# Altium schematic sheet Opamp-Sheet2.SchDoc
size A4; DocumentNumber: 2; SheetNumber: 2; SheetTotal: 3
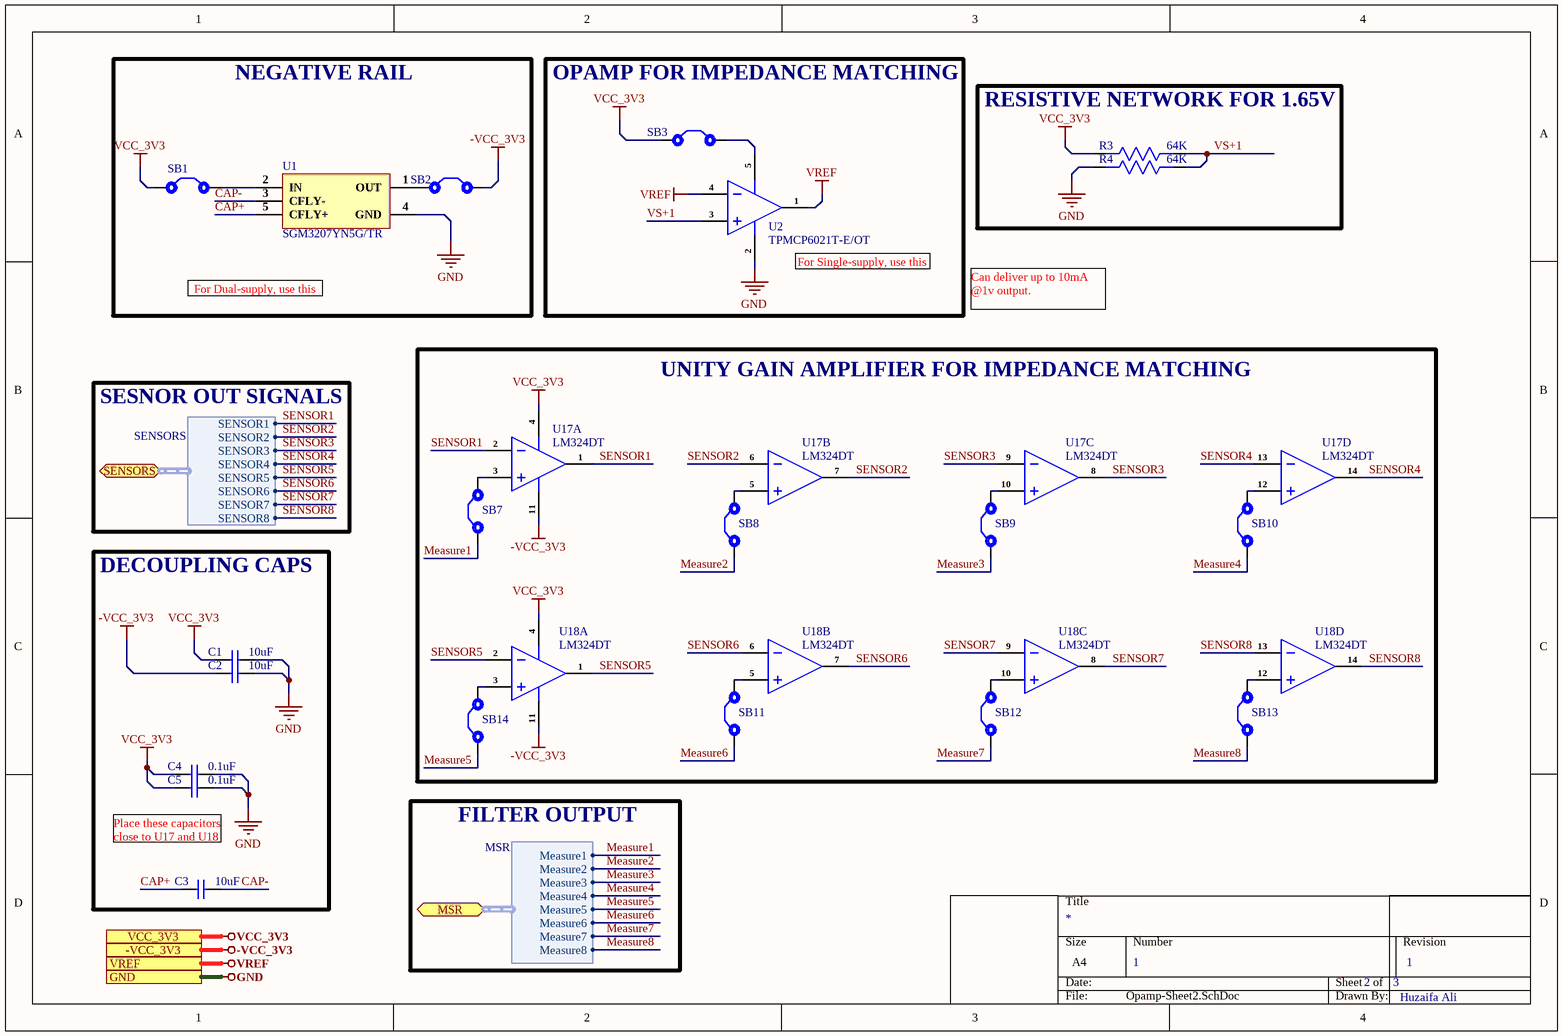
[diagram p0: Opamp-Sheet2.SchDoc]

## Parts
C1  10uF  [Cap-0603]
C2  10uF  [Cap-0603]
C3  10uF  [Cap-0603]
C4  0.1uF  [Cap-0402]
C5  0.1uF  [Cap-0402]
R3  64K  [Res-0603]
R4  64K  [Res-0603]
SB1  Solder Bridge  [Solder Bridge]  (value not drawn)
SB2  Solder Bridge  [Solder Bridge]  (value not drawn)
SB3  Solder Bridge  [Solder Bridge]  (value not drawn)
SB7  Solder Bridge 0603  [Solder Bridge]  (value not drawn)  (no BOM)
SB8  Solder Bridge 0603  [Solder Bridge]  (value not drawn)  (no BOM)
SB9  Solder Bridge 0603  [Solder Bridge]  (value not drawn)  (no BOM)
SB10  Solder Bridge 0603  [Solder Bridge]  (value not drawn)  (no BOM)
SB11  Solder Bridge 0603  [Solder Bridge]  (value not drawn)  (no BOM)
SB12  Solder Bridge 0603  [Solder Bridge]  (value not drawn)  (no BOM)
SB13  Solder Bridge 0603  [Solder Bridge]  (value not drawn)  (no BOM)
SB14  Solder Bridge 0603  [Solder Bridge]  (value not drawn)  (no BOM)
U1  SGM3207YN5G/TR  [SOT-23-5]
U2  TPMCP6021T-E/OT  [SOT-23-5]
U17  LM324DT  [SO-14]  (parts A,B,C,D of 4)
U18  LM324DT  [SO-14]  (parts A,B,C,D of 4)

## Blocks framed on the sheet
NEGATIVE RAIL: SB1 SB2 U1
OPAMP FOR IMPEDANCE MATCHING: SB3 U2
RESISTIVE NETWORK FOR 1.65V: R3 R4
UNITY GAIN AMPLIFIER FOR IMPEDANCE MATCHING: SB7-SB14 U17 U18
DECOUPLING CAPS: C1-C5

## Ports
-VCC_3V3, GND, MSR (bidir, harness MSR), SENSORS (bidir, harness SENSORS), VCC_3V3, VREF

## Harnesses
SENSORS: SENSOR1, SENSOR2, SENSOR3, SENSOR4, SENSOR5, SENSOR6, SENSOR7, SENSOR8
MSR: Measure1, Measure2, Measure3, Measure4, Measure5, Measure6, Measure7, Measure8

## Nets
-VCC_3V3: C2.1 SB2.2 U17.11(VCC-) U18.11(VCC-) ; port -VCC_3V3
GND: C1.2 C2.2 C4.2 C5.2 R4.2 U1.4(GND) U2.2(V-) ; port GND
VCC_3V3: C1.1 C4.1 C5.1 R3.2 SB1.1 SB3.1 U17.4(VCC+) U18.4(VCC+) ; port VCC_3V3
VREF: U2.1(OUT) U2.4(IN-) ; port VREF
CAP+: C3.1 U1.5(CFLY+)
CAP-: C3.2 U1.3(CFLY-)
Measure1: SB7.1 ; port MSR.Measure1
Measure2: SB8.1 ; port MSR.Measure2
Measure3: SB9.1 ; port MSR.Measure3
Measure4: SB10.1 ; port MSR.Measure4
Measure5: SB14.1 ; port MSR.Measure5
Measure6: SB11.1 ; port MSR.Measure6
Measure7: SB12.1 ; port MSR.Measure7
Measure8: SB13.1 ; port MSR.Measure8
SENSOR1: U17.1(1OUT) U17.2(IN-) ; port SENSORS.SENSOR1
SENSOR2: U17.6(2IN-) U17.7(2OUT) ; port SENSORS.SENSOR2
SENSOR3: U17.8(3OUT) U17.9(3IN-) ; port SENSORS.SENSOR3
SENSOR4: U17.13(4IN-) U17.14(4OUT) ; port SENSORS.SENSOR4
SENSOR5: U18.1(1OUT) U18.2(IN-) ; port SENSORS.SENSOR5
SENSOR6: U18.6(2IN-) U18.7(2OUT) ; port SENSORS.SENSOR6
SENSOR7: U18.8(3OUT) U18.9(3IN-) ; port SENSORS.SENSOR7
SENSOR8: U18.13(4IN-) U18.14(4OUT) ; port SENSORS.SENSOR8
VS+1: R3.1 R4.1 U2.3(IN+)
NetSB1_2: SB1.2 U1.2(IN)
NetSB2_1: SB2.1 U1.1(OUT)
NetSB3_2: SB3.2 U2.5(V+)
NetSB7_2: SB7.2 U17.3(IN+)
NetSB8_2: SB8.2 U17.5(2IN+)
NetSB9_2: SB9.2 U17.10(3IN+)
NetSB10_2: SB10.2 U17.12(4IN+)
NetSB11_2: SB11.2 U18.5(2IN+)
NetSB12_2: SB12.2 U18.10(3IN+)
NetSB13_2: SB13.2 U18.12(4IN+)
NetSB14_2: SB14.2 U18.3(IN+)

## Notes on the sheet
- For Dual-supply, use this
- (near U2) For Single-supply, use this
- Can deliver up to 10mA @1v output.
- SESNOR OUT SIGNALS
- Place these capacitors close to U17 and U18
- FILTER OUTPUT
- 1
- Huzaifa Ali

## Library data of the parts
C1-C3 = CL10A106MA8NRNC: CAP CER 10UF 25V X5R 0603; Manufacturer: Samsung; Tolerance: 20%; Supplier 1: Avnet; Manufacturer Part Number: CL10A106MA8NRNC; RoHS: Yes; Category: Ceramic Capacitors; Pricing 1: 4000=0.03753, 8000=0.03700, 16000=0.03595, 24000=0.03515, 32000=0.03383, 40000=0.03304, 400000=0.03225 (USD); Mount: Surface Mount; Case/Package: 0603; Case Code (Metric): 1608; Case Code (Imperial): 0603; Contact Plating: Tin; Min Operating Temperature: -55°C; Max Operating Temperature: 85°C; Package Quantity: 1; Packaging: Tape and Reel; Capacitance: 10uF; Voltage Rating: 25V; Dielectric: X5R; Termination: Wraparound; Series: CL; Construction: Flat; Length: 0.063inch; Width: 0.031inch; Thickness: 0.035inch; Lead Free: Lead Free; RoHS Compliant: Yes; ComponentLink1URL: https://datasheet.ciiva.com/25766/cl10a106ma8nrnc-25766562.pdf?src-supplier=Digi-Key; ComponentLink1Description: https://datasheet.ciiva.com/25766/cl10a106ma8nrnc-25766562.pdf?src-supplier=Digi-Key; Supplier Part Number 1: CL10A106MA8NRNC; LCSC Part Number: C96446
C4 C5 = GRM155R71H104ME14D: CAP CER 0.1UF 50V X7R 0402; Manufacturer: Murata; Tolerance: 20%; Capacitance: 100nF; Item Type: Capacitor; Supplier 1: Avnet; Manufacturer Part Number: GRM155R71H104ME14D; Stock 1: 100000; Pricing 1: 10000=0.00444, 20000=0.00420, 40000=0.00396, 60000=0.00372, 80000=0.00348, 100000=0.00324, 1000000=0.00300 (USD); Mount: Surface Mount; Case/Package: 0402; Min Operating Temperature: -55°C; Max Operating Temperature: 125°C; Packaging: Cut Tape; Voltage Rating: 50V; Length: 0.039inch; Width: 0.02inch; Thickness: 0.022inch; ComponentLink1URL: http://www.mouser.com/ds/2/281/c02e-2905.pdf?src-supplier=Mouser; ComponentLink1Description: http://www.mouser.com/ds/2/281/c02e-2905.pdf?src-supplier=Mouser; ComponentLink2URL: http://search.murata.co.jp/Ceramy/image/img/A01X/G101/ENG/GRM155R71H104ME14-01.pdf?src-supplier=Digi-Key; ComponentLink2Description: http://search.murata.co.jp/Ceramy/image/img/A01X/G101/ENG/GRM155R71H104ME14-01.pdf?src-supplier=Digi-Key; ComponentLink3URL: http://psearch.en.murata.com/capacitor/product/GRM155R71H104ME14%23.pdf?src-supplier=Avnet; ComponentLink3Description: http://psearch.en.murata.com/capacitor/product/GRM155R71H104ME14%23.pdf?src-supplier=Avnet; Supplier Part Number 1: GRM155R71H104ME14D; RoHS: Yes; Category: Ceramic Capacitors; RoHS Compliant: Yes; LCSC Part Number: C182412
R3 R4 = ARG03DTC6402N: 1/10W Thin Film Resistor 75V ±0.5% ±25ppm/℃ -55℃~+155℃ 64kΩ 0603 Chip Resistor - Surface Mount ROHS; Manufacturer: iking Tech; Value: 64K; Manufacturer Part Number: ARG03DTC6402N; Footprint: 0603; ComponentLink1Description: LCSC; ComponentLink1URL: https://lcsc.com/product-detail/Chip-Resistor-Surface-Mount_Viking-Tech-ARG03DTC6402N_C2902643.html; LCSC Part Number: C2902643; Item Type: Resistor
SB1-SB3 = Solder Bridge: Solder Bridge ON
SB7-SB14 = Solder Bridge 0603: Solder Bridge ON; Manufacturer Part Number: Solder Bridge; Item Type: Solder Bridge
U1 = SGM3207YN5G/TR: NO Charge pump 1 -5.5V~-1.4V 1.4V~5.5V 60mA 19kHz SOT-23-5 DC-DC Converters ROHS; Manufacturer: SG Micro; Item Type: IC; Supplier 1: Avnet; Manufacturer Part Number: SGM3207YN5G/TR; RoHS: No; Category: Uncategorized; Pricing 1: 3000=0.38750, 6000=0.36250, 12000=0.33750, 18000=0.32500, 24000=0.31250, 30000=0.31250, 300000=0.30500 (USD); LCSC Part Number: C80403; Supplier Part Number 1: SGM3207YN5G/TR
U2 = TPMCP6021T-E/OT: SOT-23-5 Operational Amplifier ROHS; Manufacturer: TECH PUBLIC; Item Type: IC; Manufacturer Part Number: TPMCP6021T-E/OT; LCSC Part Number: C2923365; ComponentLink1Description: LCSC; ComponentLink1URL: https://www.lcsc.com/product-detail/Operational-Amplifier_TECH-PUBLIC-TPMCP6021T-E-OT_C2923365.html
U17 U18 = LM324DT: IC OPAMP GP 1.3MHZ 14SO; Manufacturer: STMicroelectronics; Max Supply Voltage: 30V; Min Supply Voltage: 3V; Min Dual Supply Voltage: 1.5V; Max Dual Supply Voltage: 15V; Voltage Gain: 100dB; Slew Rate: 0.4V/µs; Common Mode Rejection Ratio: 70dB; Nominal Supply Current: 1.2mA; Input Offset Voltage (Vos): 7mV; Input Bias Current: 150nA; Number of Circuits: 4; Output Current per Channel: 40mA; Dual Supply Voltage: 12V; Supply Type: Single,Dual; Input Voltage Noise Density: 40nV/sqrt Hz; Max Power Dissipation: 400mW; Supplier 1: Arrow Electronics; Manufacturer Part Number: LM324DT; RoHS: Yes; Category: Amplifiers - Op Amps, Buffer, Instrumentation; Stock 1: 287500; Pricing 1: 2500=0.18900 (USD); Mount: Surface Mount; Case/Package: SO; Number of Pins: 14; Contact Plating: Tin,Matte; Weight: 0.009143oz; Min Operating Temperature: 0°C; Max Operating Temperature: 70°C; Gain Bandwidth Product: 1.3MHz; Packaging: Cut Tape; Package Quantity: 2500; Operating Supply Current: 1.2mA; Operating Supply Voltage: 15V; Number of Channels: 4; Output Current: 40mA; Number of Elements: 4; Series: LM324; Technology: BIPOLAR; Bandwidth: 1.3MHz; Number of Amplifiers: 4; Unity Gain Bandwidth Product: 1.3MHz; Length: 8.75mm; Width: 4mm; Height: 1.65mm; Radiation Hardening: No; RoHS Compliant: Yes; Lead Free: Lead Free; REACH SVHC: No SVHC; ComponentLink1URL: https://datasheet.ciiva.com/4758/cd00000457-103203-4758032.pdf?src-supplier=Mouser; ComponentLink1Description: https://datasheet.ciiva.com/4758/cd00000457-103203-4758032.pdf?src-supplier=Mouser; ComponentLink2URL: https://datasheet.ciiva.com/8008/1834360-8008827.pdf?src-supplier=Element14; ComponentLink2Description: https://datasheet.ciiva.com/8008/1834360-8008827.pdf?src-supplier=Element14; ComponentLink3URL: https://datasheet.ciiva.com/8008/1834360-8008490.pdf?src-supplier=Element14; ComponentLink3Description: https://datasheet.ciiva.com/8008/1834360-8008490.pdf?src-supplier=Element14; ComponentLink4URL: https://datasheet.ciiva.com/28630/1834360-28630538.pdf?src-supplier=Element14; ComponentLink4Description: https://datasheet.ciiva.com/28630/1834360-28630538.pdf?src-supplier=Element14; ComponentLink5URL: https://datasheet.ciiva.com/1795/cd00000457-1795560.pdf?src-supplier=Digi-Key; ComponentLink5Description: https://datasheet.ciiva.com/1795/cd00000457-1795560.pdf?src-supplier=Digi-Key; ComponentLink6URL: https://datasheet.ciiva.com/1795/cd00000457-1795559.pdf?src-supplier=Digi-Key; ComponentLink6Description: https://datasheet.ciiva.com/1795/cd00000457-1795559.pdf?src-supplier=Digi-Key; ComponentLink7URL: https://datasheet.ciiva.com/1795/cd00000457-1795561.pdf?src-supplier=Digi-Key; ComponentLink7Description: https://datasheet.ciiva.com/1795/cd00000457-1795561.pdf?src-supplier=Digi-Key; ComponentLink8URL: https://datasheet.ciiva.com/16375/cd00000457-16375528.pdf?src-supplier=Future+Electronics; ComponentLink8Description: https://datasheet.ciiva.com/16375/cd00000457-16375528.pdf?src-supplier=Future+Electronics; Supplier Part Number 1: LM324DT